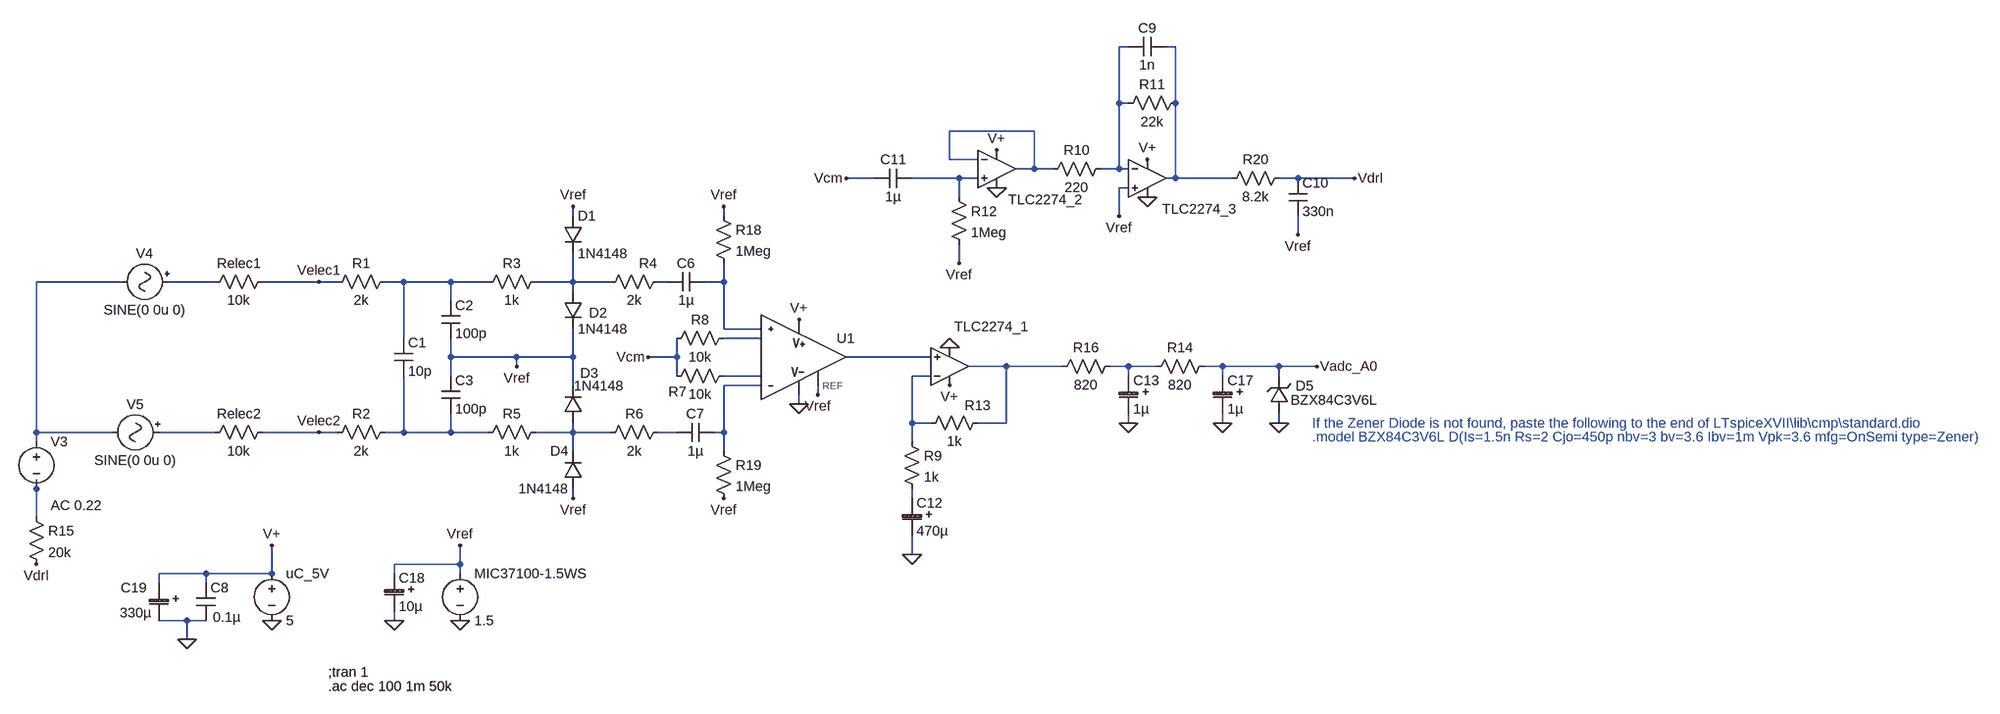
[diagram p0: schematic EEG_sch.asc]
EEG_sch.asc, the LTspice schematic file:
Version 4
SHEET 1 2836 1044
WIRE 1360 -352 1344 -352
WIRE 1440 -352 1424 -352
WIRE 1344 -256 1344 -352
WIRE 1360 -256 1344 -256
WIRE 1440 -256 1440 -352
WIRE 1200 -208 1056 -208
WIRE 1056 -160 1056 -208
WIRE 1104 -160 1056 -160
WIRE 1200 -144 1200 -208
WIRE 1200 -144 1168 -144
WIRE 1232 -144 1200 -144
WIRE 1344 -144 1344 -256
WIRE 1344 -144 1312 -144
WIRE 1360 -144 1344 -144
WIRE 928 -128 880 -128
WIRE 1072 -128 992 -128
WIRE 1104 -128 1072 -128
WIRE 1440 -128 1440 -256
WIRE 1440 -128 1424 -128
WIRE 1536 -128 1440 -128
WIRE 1648 -128 1616 -128
WIRE 1744 -128 1648 -128
WIRE 1360 -112 1344 -112
WIRE 1072 -96 1072 -128
WIRE 416 -64 416 -80
WIRE 672 -64 672 -80
WIRE 1344 -64 1344 -112
WIRE 1648 -32 1648 -64
WIRE 1072 16 1072 -16
WIRE -352 48 -496 48
WIRE -192 48 -272 48
WIRE -16 48 -112 48
WIRE 16 48 -16 48
WIRE 128 48 96 48
WIRE 208 48 128 48
WIRE 272 48 208 48
WIRE 416 48 416 0
WIRE 416 48 352 48
WIRE 480 48 416 48
WIRE 576 48 560 48
WIRE 672 48 672 16
WIRE 672 48 640 48
WIRE 416 64 416 48
WIRE 208 80 208 48
WIRE 672 128 672 48
WIRE 736 128 672 128
WIRE 128 144 128 48
WIRE 736 144 672 144
WIRE 208 176 208 144
WIRE 320 176 208 176
WIRE 416 176 416 128
WIRE 416 176 320 176
WIRE 592 176 592 144
WIRE 592 176 544 176
WIRE 1024 176 880 176
WIRE 320 192 320 176
WIRE 1152 192 1088 192
WIRE 1248 192 1152 192
WIRE 1360 192 1328 192
WIRE 1408 192 1360 192
WIRE 1520 192 1488 192
WIRE 1616 192 1520 192
WIRE 1680 192 1616 192
WIRE 208 208 208 176
WIRE 592 208 592 176
WIRE 736 208 672 208
WIRE 1024 208 992 208
WIRE 1360 208 1360 192
WIRE 1520 208 1520 192
WIRE 1616 208 1616 192
WIRE 416 224 416 176
WIRE 736 224 672 224
WIRE 832 240 832 224
WIRE 800 256 800 240
WIRE 992 288 992 208
WIRE 1024 288 992 288
WIRE 1152 288 1152 192
WIRE 1152 288 1104 288
WIRE 1360 288 1360 272
WIRE 1520 288 1520 272
WIRE 1616 288 1616 272
WIRE -496 304 -496 48
WIRE -368 304 -496 304
WIRE -192 304 -288 304
WIRE -16 304 -112 304
WIRE 16 304 -16 304
WIRE 128 304 128 208
WIRE 128 304 96 304
WIRE 208 304 208 272
WIRE 208 304 128 304
WIRE 272 304 208 304
WIRE 416 304 416 288
WIRE 416 304 352 304
WIRE 480 304 416 304
WIRE 592 304 560 304
WIRE 672 304 672 224
WIRE 672 304 656 304
WIRE -496 320 -496 304
WIRE 992 320 992 288
WIRE 416 336 416 304
WIRE 672 336 672 304
WIRE -496 400 -496 384
WIRE 416 416 416 400
WIRE 992 416 992 400
WIRE -496 448 -496 400
WIRE 992 512 992 480
WIRE 224 528 224 496
WIRE 224 528 112 528
WIRE -208 544 -288 544
WIRE -96 544 -96 496
WIRE -96 544 -208 544
WIRE 112 544 112 528
WIRE 224 544 224 528
WIRE -288 560 -288 544
WIRE -208 560 -208 544
WIRE -240 624 -288 624
WIRE -208 624 -240 624
WIRE 112 624 112 608
WIRE -240 656 -240 624
FLAG 224 624 0
FLAG -96 624 0
FLAG -96 496 V+
FLAG 224 496 Vref
FLAG 416 -80 Vref
FLAG 416 416 Vref
FLAG 320 192 Vref
FLAG -16 48 Velec1
FLAG -16 304 Velec2
FLAG 832 240 Vref
FLAG 800 112 V+
FLAG 800 256 0
FLAG 1136 -176 V+
FLAG 1136 -112 0
FLAG 1392 -96 0
FLAG 1392 -160 V+
FLAG 1072 16 Vref
FLAG 1056 160 0
FLAG 1056 224 V+
FLAG 1344 -64 Vref
FLAG 672 416 Vref
FLAG 672 -80 Vref
FLAG -240 656 0
FLAG 112 624 0
FLAG 544 176 Vcm
FLAG 880 -128 Vcm
FLAG 992 512 0
FLAG 1360 288 0
FLAG 1520 288 0
FLAG 1744 -128 Vdrl
FLAG 1616 288 0
FLAG 1680 192 Vadc_A0
FLAG -496 528 Vdrl
FLAG 1648 -32 Vref
SYMBOL res 112 32 R90
WINDOW 0 0 56 VBottom 2
WINDOW 3 32 56 VTop 2
SYMATTR InstName R1
SYMATTR Value 2k
SYMBOL res 112 288 R90
WINDOW 0 0 56 VBottom 2
WINDOW 3 32 56 VTop 2
SYMATTR InstName R2
SYMATTR Value 2k
SYMBOL cap 112 144 R0
SYMATTR InstName C1
SYMATTR Value 10p
SYMBOL cap 192 80 R0
SYMATTR InstName C2
SYMATTR Value 100p
SYMBOL cap 192 208 R0
SYMATTR InstName C3
SYMATTR Value 100p
SYMBOL res 368 32 R90
WINDOW 0 0 56 VBottom 2
WINDOW 3 32 56 VTop 2
SYMATTR InstName R3
SYMATTR Value 1k
SYMBOL res 576 32 R90
WINDOW 0 0 32 VBottom 2
WINDOW 3 32 56 VTop 2
SYMATTR InstName R4
SYMATTR Value 2k
SYMBOL res 368 288 R90
WINDOW 0 0 56 VBottom 2
WINDOW 3 32 56 VTop 2
SYMATTR InstName R5
SYMATTR Value 1k
SYMBOL res 576 288 R90
WINDOW 0 0 56 VBottom 2
WINDOW 3 32 56 VTop 2
SYMATTR InstName R6
SYMATTR Value 2k
SYMBOL diode 400 -64 R0
SYMATTR InstName D1
SYMATTR Value 1N4148
SYMBOL voltage -96 528 R0
WINDOW 123 0 0 Left 2
WINDOW 39 0 0 Left 2
SYMATTR InstName uC_5V
SYMATTR Value 5
SYMBOL voltage 224 528 R0
WINDOW 123 0 0 Left 2
WINDOW 39 0 0 Left 2
SYMATTR InstName MIC37100-1.5WS
SYMATTR Value 1.5
SYMBOL res 688 192 R90
WINDOW 0 59 94 VBottom 2
WINDOW 3 32 56 VTop 2
SYMATTR InstName R7
SYMATTR Value 10k
SYMBOL res 688 128 R90
WINDOW 0 0 56 VBottom 2
WINDOW 3 32 56 VTop 2
SYMATTR InstName R8
SYMATTR Value 10k
SYMBOL Opamps\\UniversalOpamp2 1136 -144 R0
WINDOW 0 20 52 Left 2
SYMATTR InstName TLC2274_2
SYMBOL Opamps\\UniversalOpamp2 1392 -128 R0
WINDOW 0 25 52 Left 2
SYMATTR InstName TLC2274_3
SYMBOL res 1328 -160 R90
WINDOW 0 0 56 VBottom 2
WINDOW 3 32 56 VTop 2
SYMATTR InstName R10
SYMATTR Value 220
SYMBOL res 1456 -272 R90
WINDOW 0 0 56 VBottom 2
WINDOW 3 32 56 VTop 2
SYMATTR InstName R11
SYMATTR Value 22k
SYMBOL res 1056 -112 R0
SYMATTR InstName R12
SYMATTR Value 1Meg
SYMBOL Opamps\\UniversalOpamp2 1056 192 M180
WINDOW 0 8 68 Left 2
SYMATTR InstName TLC2274_1
SYMBOL res 976 304 R0
SYMATTR InstName R9
SYMATTR Value 1k
SYMBOL res 1504 176 R90
WINDOW 0 0 56 VBottom 2
WINDOW 3 32 56 VTop 2
SYMATTR InstName R14
SYMATTR Value 820
SYMBOL res -96 32 R90
WINDOW 0 0 56 VBottom 2
WINDOW 3 32 56 VTop 2
SYMATTR InstName Relec1
SYMATTR Value 10k
SYMBOL res -96 288 R90
WINDOW 0 0 56 VBottom 2
WINDOW 3 32 56 VTop 2
SYMATTR InstName Relec2
SYMATTR Value 10k
SYMBOL cap 640 32 R90
WINDOW 0 0 32 VBottom 2
WINDOW 3 32 32 VTop 2
SYMATTR InstName C6
SYMATTR Value 1µ
SYMBOL cap 656 288 R90
WINDOW 0 0 32 VBottom 2
WINDOW 3 32 32 VTop 2
SYMATTR InstName C7
SYMATTR Value 1µ
SYMBOL res 656 -80 R0
SYMATTR InstName R18
SYMATTR Value 1Meg
SYMBOL res 656 320 R0
SYMATTR InstName R19
SYMATTR Value 1Meg
SYMBOL diode 400 64 R0
WINDOW 0 43 37 Left 2
SYMATTR InstName D2
SYMATTR Value 1N4148
SYMBOL diode 432 288 R180
WINDOW 0 -27 85 Left 2
WINDOW 3 -70 63 Left 2
SYMATTR InstName D3
SYMATTR Value 1N4148
SYMBOL diode 432 400 R180
WINDOW 0 24 64 Left 2
WINDOW 3 24 0 Left 2
SYMATTR InstName D4
SYMATTR Value 1N4148
SYMBOL cap -224 560 R0
WINDOW 3 28 58 Left 2
SYMATTR Value 0.1µ
SYMATTR InstName C8
SYMBOL cap 992 -144 R90
WINDOW 0 0 32 VBottom 2
WINDOW 3 32 32 VTop 2
SYMATTR InstName C11
SYMATTR Value 1µ
SYMBOL res 1632 -144 R90
WINDOW 0 0 56 VBottom 2
WINDOW 3 32 56 VTop 2
SYMATTR InstName R20
SYMATTR Value 8.2k
SYMBOL res 1120 272 R90
WINDOW 0 2 16 VBottom 2
WINDOW 3 32 56 VTop 2
SYMATTR InstName R13
SYMATTR Value 1k
SYMBOL res 1344 176 R90
WINDOW 0 0 56 VBottom 2
WINDOW 3 32 56 VTop 2
SYMATTR InstName R16
SYMATTR Value 820
SYMBOL Misc\\signal -256 48 R90
WINDOW 0 -32 56 VBottom 2
WINDOW 3 32 56 VTop 2
WINDOW 123 0 0 Left 2
WINDOW 39 0 0 Left 2
SYMATTR InstName V4
SYMATTR Value SINE(0 0u 0)
SYMBOL Misc\\signal -272 304 R90
WINDOW 0 -32 56 VBottom 2
WINDOW 3 32 56 VTop 2
WINDOW 123 0 0 Left 2
WINDOW 39 0 0 Left 2
SYMATTR InstName V5
SYMATTR Value SINE(0 0u 0)
SYMBOL res -512 432 R0
SYMATTR InstName R15
SYMATTR Value 20k
SYMBOL voltage -496 304 R0
WINDOW 123 24 124 Left 2
WINDOW 39 0 0 Left 2
SYMATTR Value2 AC 0.22
SYMATTR InstName V3
SYMATTR Value ""
SYMBOL cap 1424 -368 R90
WINDOW 0 0 32 VBottom 2
WINDOW 3 32 32 VTop 2
SYMATTR InstName C9
SYMATTR Value 1n
SYMBOL cap 1632 -128 R0
SYMATTR InstName C10
SYMATTR Value 330n
SYMBOL AD623 848 176 R0
SYMATTR InstName U1
SYMBOL PolCap 976 416 R0
SYMATTR InstName C12
SYMATTR Value 470µ
SYMBOL PolCap 1344 208 R0
SYMATTR InstName C13
SYMATTR Value 1µ
SYMBOL PolCap 1504 208 R0
SYMATTR InstName C17
SYMATTR Value 1µ
SYMBOL PolCap 96 544 R0
SYMATTR InstName C18
SYMATTR Value 10µ
SYMBOL PolCap -304 560 R0
WINDOW 0 -49 8 Left 2
WINDOW 3 -50 51 Left 2
SYMATTR InstName C19
SYMATTR Value 330µ
SYMBOL zener 1632 272 R180
WINDOW 0 -43 47 Left 2
WINDOW 3 -151 23 Left 2
SYMATTR InstName D5
SYMATTR Value BZX84C3V6L
TEXT 0 712 Left 2 !;tran 1
TEXT 0 736 Left 2 !.ac dec 100 1m 50k
TEXT 1672 288 Left 2 ;If the Zener Diode is not found, paste the following to the end of LTspiceXVII\\lib\\cmp\\standard.dio
TEXT 1672 312 Left 2 ;.model BZX84C3V6L D(Is=1.5n Rs=2 Cjo=450p nbv=3 bv=3.6 Ibv=1m Vpk=3.6 mfg=OnSemi type=Zener)

The netlist it stands for:
* EEG_sch.asc
R1 N007 Velec1 2k
R2 N019 Velec2 2k
C1 N007 N019 10p
C2 N007 Vref 100p
C3 Vref N019 100p
R3 N008 N007 1k
R4 N009 N008 2k
R5 N020 N019 1k
R6 N021 N020 2k
D1 Vref N008 1N4148
V§uC_5V V+ 0 5
V§MIC37100-1.5WS Vref 0 1.5
R7 N015 Vcm 10k
R8 N011 Vcm 10k
XTLC2274_2 N004 N003 V+ 0 N003 level.2 Avol=1Meg GBW=10Meg Slew=10Meg ilimit=25m rail=0 Vos=0 phimargin=45 en=0 enk=0 in=0 ink=0 Rin=500Meg  ; pins IN+ IN- V+ V- OUT
XTLC2274_3 Vref N001 V+ 0 N002 level.2 Avol=1Meg GBW=10Meg Slew=10Meg ilimit=25m rail=0 Vos=0 phimargin=45 en=0 enk=0 in=0 ink=0 Rin=500Meg  ; pins IN+ IN- V+ V- OUT
R10 N001 N003 220
R11 N002 N001 22k
R12 N004 Vref 1Meg
XTLC2274_1 N012 N016 V+ 0 N013 level.2 Avol=1Meg GBW=10Meg Slew=10Meg ilimit=25m rail=0 Vos=0 phimargin=45 en=0 enk=0 in=0 ink=0 Rin=500Meg  ; pins IN+ IN- V+ V- OUT
R9 N016 N023 1k
R14 Vadc_A0 N014 820
Relec1 Velec1 N006 10k
Relec2 Velec2 N018 10k
C6 N010 N009 1µ
C7 N017 N021 1µ
R18 Vref N010 1Meg
R19 N017 Vref 1Meg
D2 N008 Vref 1N4148
D3 N020 Vref 1N4148
D4 Vref N020 1N4148
C8 V+ 0 0.1µ
C11 N004 Vcm 1µ
R20 Vdrl N002 8.2k
R13 N013 N016 1k
R16 N014 N013 820
V4 N006 N005 SINE(0 0u 0)
V5 N018 N005 SINE(0 0u 0)
R15 N022 Vdrl 20k
V3 N005 N022 AC 0.22
C9 N002 N001 1n
C10 Vdrl Vref 330n
XU1 N010 N017 N011 N015 V+ 0 N012 Vref AD623  ; pins In+ In- RG+ RG- V+ V- OUT REF
C12 N023 0 470µ
C13 N014 0 1µ
C17 Vadc_A0 0 1µ
C18 Vref 0 10µ
C19 V+ 0 330µ
D5 0 Vadc_A0 BZX84C3V6L
.model D D
.lib standard.dio
;tran 1
.ac dec 100 1m 50k
* If the Zener Diode is not found, paste the following to the end of LTspiceXVII\lib\cmp\standard.dio
* .model BZX84C3V6L D(Is=1.5n Rs=2 Cjo=450p nbv=3 bv=3.6 Ibv=1m Vpk=3.6 mfg=OnSemi type=Zener)
.lib UniversalOpamps2.sub
.lib ad623.lib
.backanno
.end